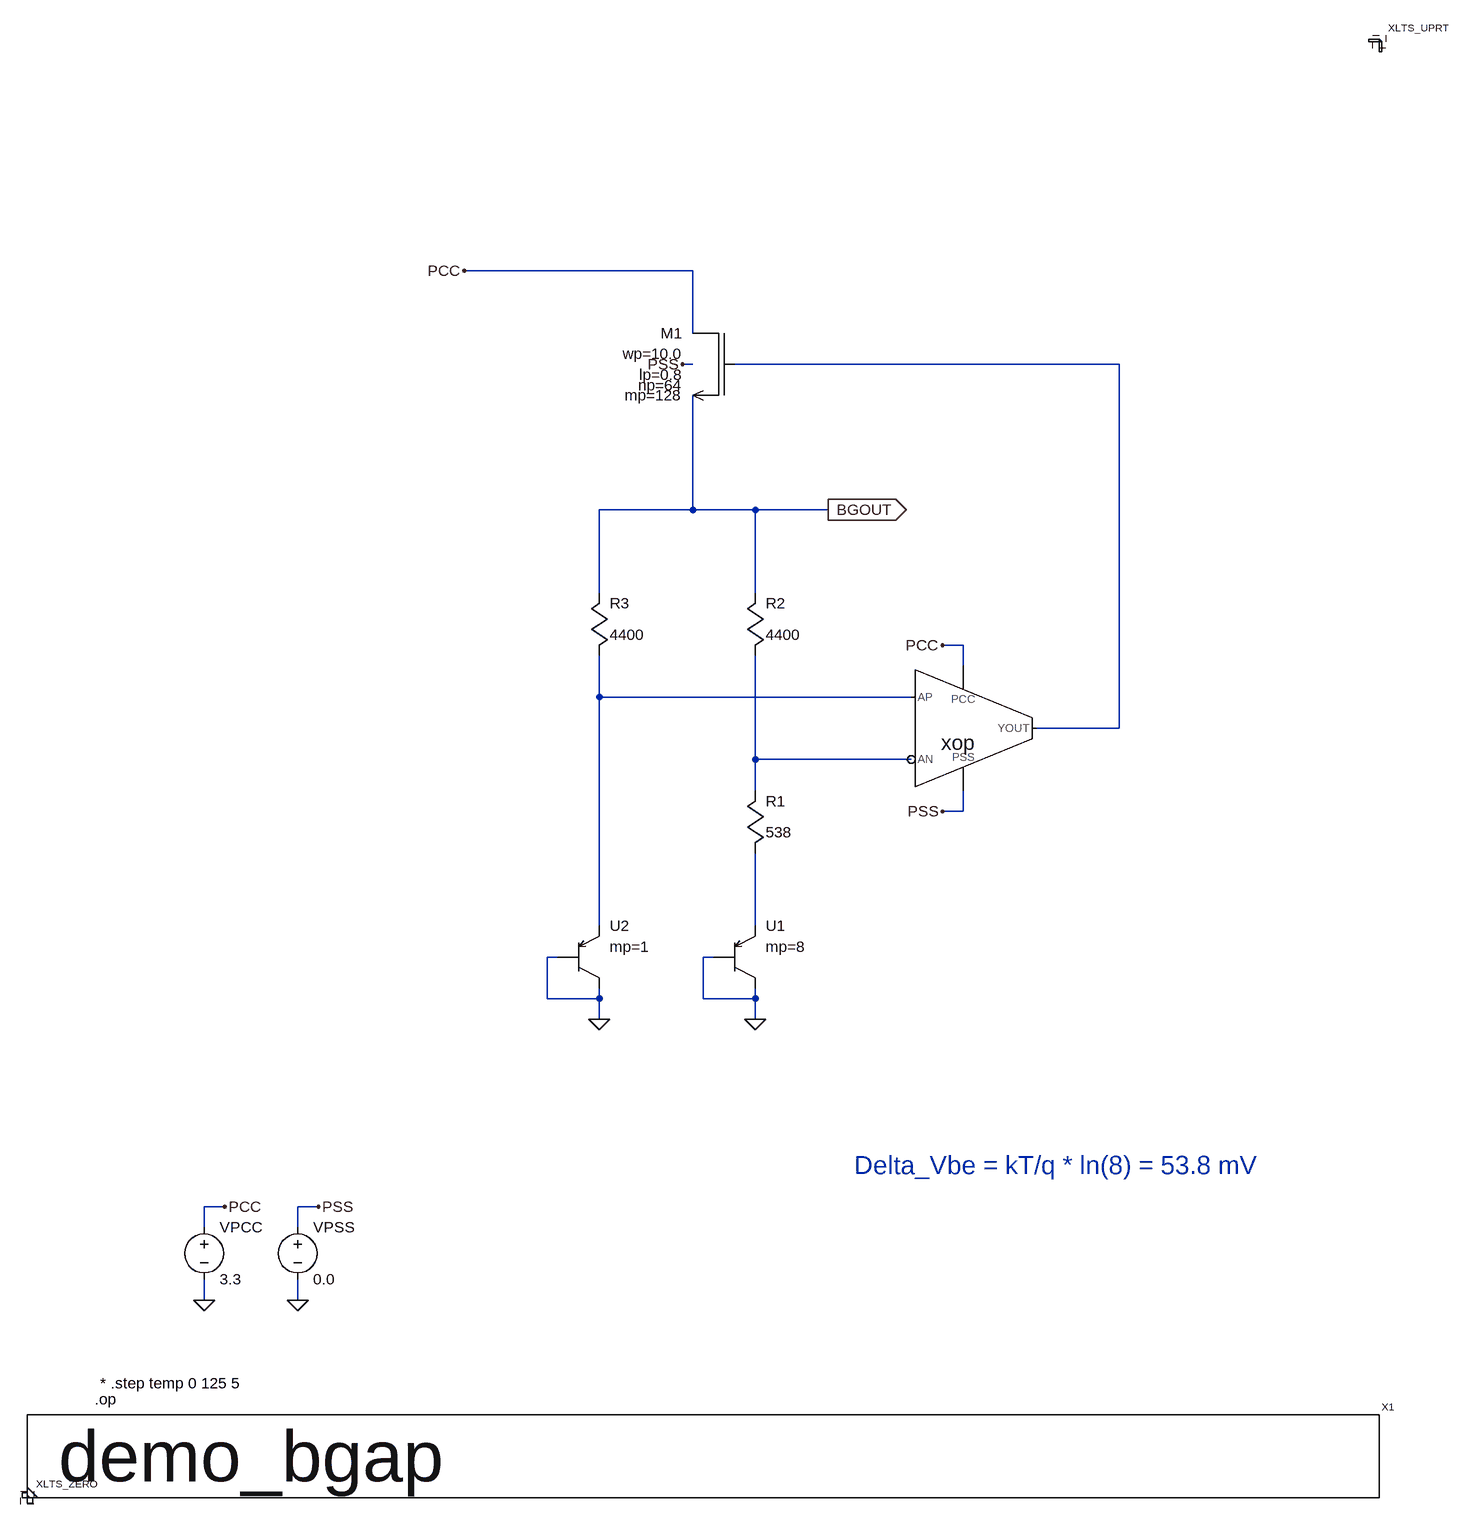
[diagram p0: schematic demo_bgap.asc]
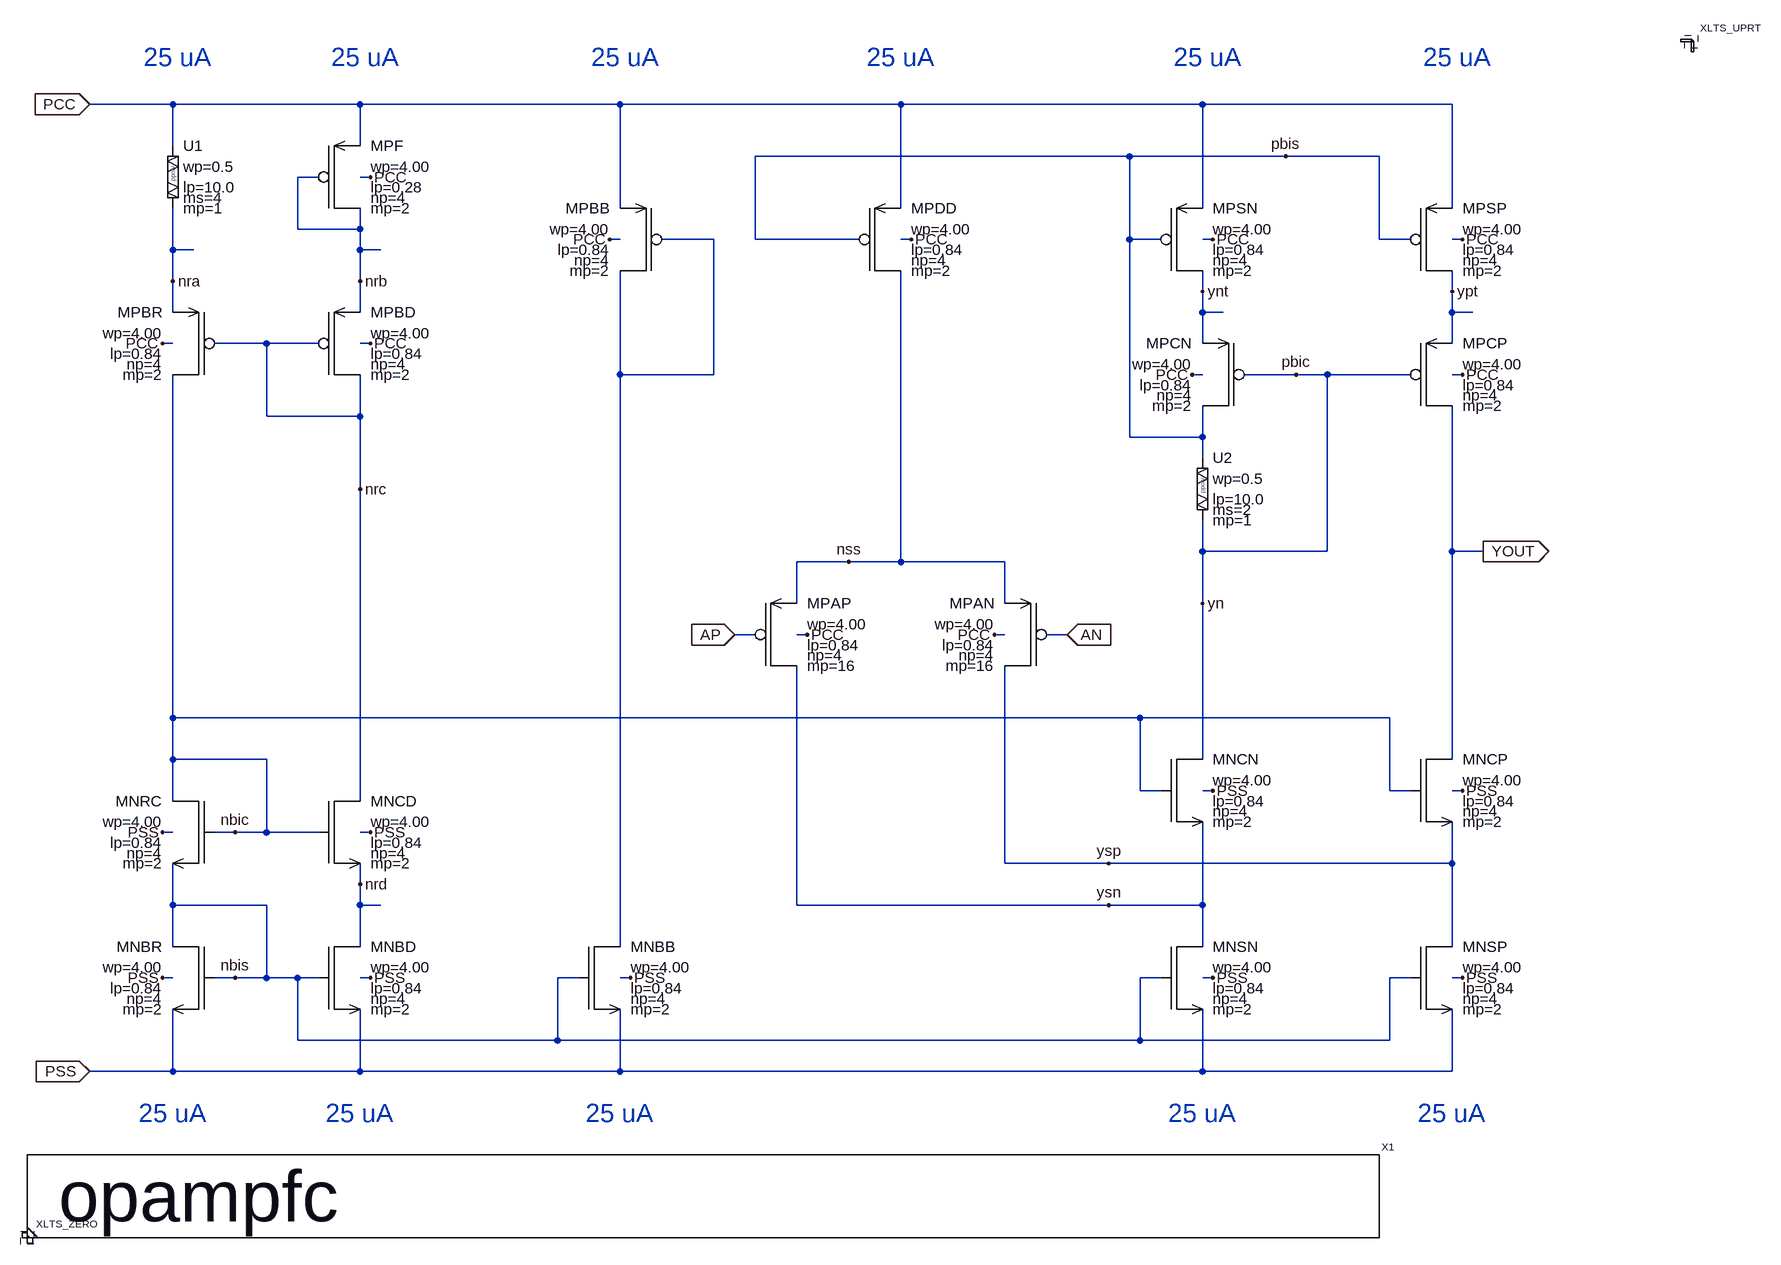
[diagram p1: sub-circuit opampfc.asc]
demo_bgap.asc, the LTspice schematic file:
Version 4.1
SHEET 1 4824 680
WIRE 1024 -1888 672 -1888
WIRE 1024 -1792 1024 -1888
WIRE 1024 -1744 1008 -1744
WIRE 1680 -1744 1088 -1744
WIRE 1024 -1520 1024 -1696
WIRE 1024 -1520 880 -1520
WIRE 1120 -1520 1024 -1520
WIRE 1232 -1520 1120 -1520
WIRE 880 -1392 880 -1520
WIRE 1120 -1392 1120 -1520
WIRE 1440 -1312 1408 -1312
WIRE 1440 -1280 1440 -1312
WIRE 880 -1232 880 -1296
WIRE 1360 -1232 880 -1232
WIRE 1680 -1184 1680 -1744
WIRE 1680 -1184 1552 -1184
WIRE 1120 -1136 1120 -1296
WIRE 1360 -1136 1120 -1136
WIRE 1120 -1088 1120 -1136
WIRE 1440 -1056 1440 -1088
WIRE 1440 -1056 1408 -1056
WIRE 880 -880 880 -1232
WIRE 1120 -880 1120 -992
WIRE 816 -832 800 -832
WIRE 1056 -832 1040 -832
WIRE 800 -768 800 -832
WIRE 880 -768 880 -784
WIRE 880 -768 800 -768
WIRE 1040 -768 1040 -832
WIRE 1120 -768 1120 -784
WIRE 1120 -768 1040 -768
WIRE 880 -736 880 -768
WIRE 1120 -736 1120 -768
WIRE 304 -448 272 -448
WIRE 448 -448 416 -448
WIRE 272 -416 272 -448
WIRE 416 -416 416 -448
WIRE 272 -304 272 -336
WIRE 416 -304 416 -336
FLAG 272 -304 0
FLAG 304 -448 PCC
FLAG 416 -304 0
FLAG 448 -448 PSS
FLAG 1120 -736 0
FLAG 880 -736 0
FLAG 1008 -1744 PSS
FLAG 1232 -1520 BGOUT
IOPIN 1232 -1520 Out
FLAG 1408 -1312 PCC
FLAG 1408 -1056 PSS
FLAG 672 -1888 PCC
DATAFLAG 784 -1888 ""
DATAFLAG 1184 -1520 ""
DATAFLAG 1264 -1232 ""
DATAFLAG 1264 -1136 ""
DATAFLAG 1600 -1184 ""
DATAFLAG 1120 -944 ""
DATAFLAG 880 -944 ""
DATAFLAG 1120 -688 "Ix(U1:e)"
DATAFLAG 880 -688 "Ix(U2:e)"
SYMBOL BD_GTitleLTS 0 0 R0
SYMATTR SpiceModel demo_bgap
SYMATTR InstName X1
SYMBOL voltage 272 -432 R0
SYMATTR InstName VPCC
SYMATTR Value 3.3
SYMBOL voltage 416 -432 R0
SYMATTR InstName VPSS
SYMATTR Value 0.0
SYMBOL opampfc 1360 -1088 R0
SYMATTR InstName xop
SYMBOL BD_ZERO 0 0 R0
SYMATTR InstName XLTS_ZERO
SYMBOL BD_UPRT 2080 -2240 R0
SYMATTR InstName XLTS_UPRT
SYMBOL gfmcu_vpnp_10x10 1056 -832 R0
SYMATTR InstName U1
SYMATTR Value mp=8
SYMBOL gfmcu_vpnp_10x10 816 -832 R0
SYMATTR InstName U2
SYMBOL gres 1120 -1088 R0
SYMATTR Value 538
SYMATTR InstName R1
SYMBOL gres 1120 -1392 R0
SYMATTR Value 4400
SYMATTR InstName R2
SYMBOL gres 880 -1392 R0
SYMATTR Value 4400
SYMATTR InstName R3
SYMBOL gfmcu_nmos3p3 1088 -1744 M0
SYMATTR Value wp=10.0
SYMATTR InstName M1
SYMATTR Value2 lp=0.8
SYMATTR SpiceLine np=64
SYMATTR SpiceLine2 mp=128
TEXT 104 -152 Left 2 !.op
TEXT 112 -176 Left 2 !* .step temp 0 125 5
TEXT 1272 -512 Left 4 ;Delta_Vbe = kT/q * ln(8) = 53.8 mV

opampfc.asc, the sub-circuit schematic file:
Version 4.1
SHEET 1 4824 680
WIRE 224 -1744 96 -1744
WIRE 512 -1744 224 -1744
WIRE 912 -1744 512 -1744
WIRE 1344 -1744 912 -1744
WIRE 1808 -1744 1344 -1744
WIRE 2192 -1744 1808 -1744
WIRE 224 -1680 224 -1744
WIRE 512 -1680 512 -1744
WIRE 1696 -1664 1120 -1664
WIRE 1936 -1664 1696 -1664
WIRE 2080 -1664 1936 -1664
WIRE 448 -1632 416 -1632
WIRE 528 -1632 512 -1632
WIRE 912 -1584 912 -1744
WIRE 1344 -1584 1344 -1744
WIRE 1808 -1584 1808 -1744
WIRE 2192 -1584 2192 -1744
WIRE 416 -1552 416 -1632
WIRE 512 -1552 512 -1584
WIRE 512 -1552 416 -1552
WIRE 912 -1536 896 -1536
WIRE 1056 -1536 976 -1536
WIRE 1120 -1536 1120 -1664
WIRE 1280 -1536 1120 -1536
WIRE 1360 -1536 1344 -1536
WIRE 1696 -1536 1696 -1664
WIRE 1744 -1536 1696 -1536
WIRE 1824 -1536 1808 -1536
WIRE 2080 -1536 2080 -1664
WIRE 2128 -1536 2080 -1536
WIRE 2208 -1536 2192 -1536
WIRE 224 -1520 224 -1584
WIRE 256 -1520 224 -1520
WIRE 512 -1520 512 -1552
WIRE 544 -1520 512 -1520
WIRE 224 -1472 224 -1520
WIRE 512 -1472 512 -1520
WIRE 1808 -1456 1808 -1488
WIRE 2192 -1456 2192 -1488
WIRE 224 -1424 224 -1472
WIRE 512 -1424 512 -1472
WIRE 1808 -1424 1808 -1456
WIRE 1840 -1424 1808 -1424
WIRE 2192 -1424 2192 -1456
WIRE 2224 -1424 2192 -1424
WIRE 224 -1376 208 -1376
WIRE 368 -1376 288 -1376
WIRE 448 -1376 368 -1376
WIRE 528 -1376 512 -1376
WIRE 1808 -1376 1808 -1424
WIRE 2192 -1376 2192 -1424
WIRE 912 -1328 912 -1488
WIRE 1056 -1328 1056 -1536
WIRE 1056 -1328 912 -1328
WIRE 1808 -1328 1792 -1328
WIRE 1952 -1328 1872 -1328
WIRE 2000 -1328 1952 -1328
WIRE 2128 -1328 2000 -1328
WIRE 2208 -1328 2192 -1328
WIRE 368 -1264 368 -1376
WIRE 512 -1264 512 -1328
WIRE 512 -1264 368 -1264
WIRE 1696 -1232 1696 -1536
WIRE 1808 -1232 1808 -1280
WIRE 1808 -1232 1696 -1232
WIRE 1808 -1200 1808 -1232
WIRE 512 -1152 512 -1264
WIRE 1808 -1056 1808 -1104
WIRE 2000 -1056 2000 -1328
WIRE 2000 -1056 1808 -1056
WIRE 2192 -1056 2192 -1280
WIRE 2240 -1056 2192 -1056
WIRE 1264 -1040 1184 -1040
WIRE 1344 -1040 1344 -1488
WIRE 1344 -1040 1264 -1040
WIRE 1504 -1040 1344 -1040
WIRE 1184 -976 1184 -1040
WIRE 1504 -976 1504 -1040
WIRE 1808 -976 1808 -1056
WIRE 1120 -928 1088 -928
WIRE 1200 -928 1184 -928
WIRE 1504 -928 1488 -928
WIRE 1600 -928 1568 -928
WIRE 224 -800 224 -1328
WIRE 1712 -800 224 -800
WIRE 2096 -800 1712 -800
WIRE 224 -736 224 -800
WIRE 368 -736 224 -736
WIRE 1808 -736 1808 -976
WIRE 2192 -736 2192 -1056
WIRE 1712 -688 1712 -800
WIRE 1744 -688 1712 -688
WIRE 1824 -688 1808 -688
WIRE 2096 -688 2096 -800
WIRE 2128 -688 2096 -688
WIRE 2208 -688 2192 -688
WIRE 224 -672 224 -736
WIRE 512 -672 512 -1152
WIRE 224 -624 208 -624
WIRE 320 -624 288 -624
WIRE 368 -624 368 -736
WIRE 368 -624 320 -624
WIRE 448 -624 368 -624
WIRE 528 -624 512 -624
WIRE 1504 -576 1504 -880
WIRE 1664 -576 1504 -576
WIRE 2192 -576 2192 -640
WIRE 2192 -576 1664 -576
WIRE 512 -544 512 -576
WIRE 224 -512 224 -576
WIRE 368 -512 224 -512
WIRE 512 -512 512 -544
WIRE 544 -512 512 -512
WIRE 1184 -512 1184 -880
WIRE 1664 -512 1184 -512
WIRE 1808 -512 1808 -640
WIRE 1808 -512 1664 -512
WIRE 224 -448 224 -512
WIRE 512 -448 512 -512
WIRE 912 -448 912 -1328
WIRE 1808 -448 1808 -512
WIRE 2192 -448 2192 -576
WIRE 224 -400 208 -400
WIRE 320 -400 288 -400
WIRE 368 -400 368 -512
WIRE 368 -400 320 -400
WIRE 416 -400 368 -400
WIRE 448 -400 416 -400
WIRE 528 -400 512 -400
WIRE 848 -400 816 -400
WIRE 928 -400 912 -400
WIRE 1744 -400 1712 -400
WIRE 1824 -400 1808 -400
WIRE 2128 -400 2096 -400
WIRE 2208 -400 2192 -400
WIRE 416 -304 416 -400
WIRE 816 -304 816 -400
WIRE 816 -304 416 -304
WIRE 1712 -304 1712 -400
WIRE 1712 -304 816 -304
WIRE 2096 -304 2096 -400
WIRE 2096 -304 1712 -304
WIRE 224 -256 224 -352
WIRE 224 -256 96 -256
WIRE 512 -256 512 -352
WIRE 512 -256 224 -256
WIRE 912 -256 912 -352
WIRE 912 -256 512 -256
WIRE 1808 -256 1808 -352
WIRE 1808 -256 912 -256
WIRE 2192 -256 2192 -352
WIRE 2192 -256 1808 -256
FLAG 528 -1376 PCC
FLAG 208 -1376 PCC
FLAG 528 -1632 PCC
FLAG 208 -400 PSS
FLAG 528 -400 PSS
FLAG 96 -256 PSS
IOPIN 96 -256 In
FLAG 96 -1744 PCC
IOPIN 96 -1744 In
FLAG 1200 -928 PCC
FLAG 1488 -928 PCC
FLAG 1824 -400 PSS
FLAG 1360 -1536 PCC
FLAG 896 -1536 PCC
FLAG 1824 -1536 PCC
FLAG 2208 -1536 PCC
FLAG 1792 -1328 PCC
FLAG 2208 -1328 PCC
FLAG 2208 -400 PSS
FLAG 1824 -688 PSS
FLAG 2208 -688 PSS
FLAG 208 -624 PSS
FLAG 528 -624 PSS
FLAG 928 -400 PSS
FLAG 1088 -928 AP
IOPIN 1088 -928 In
FLAG 1264 -1040 nss
FLAG 1936 -1664 pbis
FLAG 1952 -1328 pbic
FLAG 320 -400 nbis
FLAG 320 -624 nbic
FLAG 1808 -976 yn
FLAG 2240 -1056 YOUT
IOPIN 2240 -1056 Out
FLAG 1664 -576 ysp
FLAG 1664 -512 ysn
FLAG 1808 -1456 ynt
FLAG 2192 -1456 ypt
FLAG 224 -1472 nra
FLAG 512 -1472 nrb
FLAG 512 -1152 nrc
FLAG 512 -544 nrd
FLAG 1600 -928 AN
IOPIN 1600 -928 In
DATAFLAG 256 -1520 ""
DATAFLAG 544 -1520 ""
DATAFLAG 288 -512 ""
DATAFLAG 512 -224 "Ix(MNBD:ND)"
DATAFLAG 224 -224 "Ix(MNBR:ND)"
DATAFLAG 912 -224 "Ix(MNBB:ND)"
DATAFLAG 512 -1760 "Ix(MPBD:NS)"
DATAFLAG 224 -1760 "Ix(MPBR:NS)"
DATAFLAG 1344 -1760 "Ix(MPDD:NS)"
DATAFLAG 1808 -1760 "Ix(MPSN:NS)"
DATAFLAG 2192 -1760 "Ix(MPSP:NS)"
DATAFLAG 1808 -224 "Ix(MNSN:ND)"
DATAFLAG 2192 -224 "Ix(MNSP:ND)"
DATAFLAG 912 -1760 "Ix(MPBB:NS)"
DATAFLAG 224 -1040 ""
DATAFLAG 512 -1040 ""
DATAFLAG 544 -512 ""
DATAFLAG 912 -1040 ""
DATAFLAG 1808 -864 ""
DATAFLAG 2192 -864 ""
DATAFLAG 1840 -1424 ""
DATAFLAG 2224 -1424 ""
DATAFLAG 1440 -1664 ""
DATAFLAG 1584 -304 ""
DATAFLAG 1584 -576 ""
DATAFLAG 1584 -512 ""
SYMBOL BD_GTitleLTS 0 0 R0
SYMATTR SpiceModel opampfc
SYMATTR InstName X1
SYMBOL gfmcu_pmos3p3 448 -1376 R0
SYMATTR Value wp=4.00
SYMATTR InstName MPBD
SYMATTR Value2 lp=0.84
SYMATTR SpiceLine np=4
SYMATTR SpiceLine2 mp=2
SYMBOL gfmcu_pmos3p3 288 -1376 M0
SYMATTR Value wp=4.00
SYMATTR InstName MPBR
SYMATTR Value2 lp=0.84
SYMATTR SpiceLine np=4
SYMATTR SpiceLine2 mp=2
SYMBOL gfmcu_pmos3p3 448 -1632 R0
SYMATTR Value wp=4.00
SYMATTR InstName MPF
SYMATTR SpiceLine np=4
SYMATTR SpiceLine2 mp=2
SYMBOL gfmcu_nmos3p3 448 -400 R0
SYMATTR Value wp=4.00
SYMATTR InstName MNBD
SYMATTR Value2 lp=0.84
SYMATTR SpiceLine np=4
SYMATTR SpiceLine2 mp=2
SYMBOL gfmcu_nmos3p3 288 -400 M0
SYMATTR Value wp=4.00
SYMATTR InstName MNBR
SYMATTR Value2 lp=0.84
SYMATTR SpiceLine np=4
SYMATTR SpiceLine2 mp=2
SYMBOL gfmcu_ppolyf_u 224 -1680 R0
SYMATTR Value wp=0.5
SYMATTR InstName U1
SYMATTR Value2 lp=10.0
SYMATTR SpiceLine ms=4
SYMBOL gfmcu_pmos3p3 1120 -928 R0
SYMATTR Value wp=4.00
SYMATTR InstName MPAP
SYMATTR Value2 lp=0.84
SYMATTR SpiceLine np=4
SYMATTR SpiceLine2 mp=16
SYMBOL gfmcu_pmos3p3 1568 -928 M0
SYMATTR Value wp=4.00
SYMATTR InstName MPAN
SYMATTR Value2 lp=0.84
SYMATTR SpiceLine np=4
SYMATTR SpiceLine2 mp=16
SYMBOL gfmcu_nmos3p3 1744 -400 R0
SYMATTR Value wp=4.00
SYMATTR InstName MNSN
SYMATTR Value2 lp=0.84
SYMATTR SpiceLine np=4
SYMATTR SpiceLine2 mp=2
SYMBOL gfmcu_pmos3p3 1280 -1536 R0
SYMATTR Value wp=4.00
SYMATTR InstName MPDD
SYMATTR Value2 lp=0.84
SYMATTR SpiceLine np=4
SYMATTR SpiceLine2 mp=2
SYMBOL gfmcu_pmos3p3 976 -1536 M0
SYMATTR Value wp=4.00
SYMATTR InstName MPBB
SYMATTR Value2 lp=0.84
SYMATTR SpiceLine np=4
SYMATTR SpiceLine2 mp=2
SYMBOL gfmcu_pmos3p3 1744 -1536 R0
SYMATTR Value wp=4.00
SYMATTR InstName MPSN
SYMATTR Value2 lp=0.84
SYMATTR SpiceLine np=4
SYMATTR SpiceLine2 mp=2
SYMBOL gfmcu_pmos3p3 2128 -1536 R0
SYMATTR Value wp=4.00
SYMATTR InstName MPSP
SYMATTR Value2 lp=0.84
SYMATTR SpiceLine np=4
SYMATTR SpiceLine2 mp=2
SYMBOL gfmcu_pmos3p3 1872 -1328 M0
SYMATTR Value wp=4.00
SYMATTR InstName MPCN
SYMATTR Value2 lp=0.84
SYMATTR SpiceLine np=4
SYMATTR SpiceLine2 mp=2
SYMBOL gfmcu_pmos3p3 2128 -1328 R0
SYMATTR Value wp=4.00
SYMATTR InstName MPCP
SYMATTR Value2 lp=0.84
SYMATTR SpiceLine np=4
SYMATTR SpiceLine2 mp=2
SYMBOL gfmcu_nmos3p3 2128 -400 R0
SYMATTR Value wp=4.00
SYMATTR InstName MNSP
SYMATTR Value2 lp=0.84
SYMATTR SpiceLine np=4
SYMATTR SpiceLine2 mp=2
SYMBOL gfmcu_nmos3p3 1744 -688 R0
SYMATTR Value wp=4.00
SYMATTR InstName MNCN
SYMATTR Value2 lp=0.84
SYMATTR SpiceLine np=4
SYMATTR SpiceLine2 mp=2
SYMBOL gfmcu_nmos3p3 2128 -688 R0
SYMATTR Value wp=4.00
SYMATTR InstName MNCP
SYMATTR Value2 lp=0.84
SYMATTR SpiceLine np=4
SYMATTR SpiceLine2 mp=2
SYMBOL gfmcu_ppolyf_u 1808 -1200 R0
SYMATTR Value wp=0.5
SYMATTR InstName U2
SYMATTR Value2 lp=10.0
SYMATTR SpiceLine ms=2
SYMBOL gfmcu_nmos3p3 448 -624 R0
SYMATTR Value wp=4.00
SYMATTR InstName MNCD
SYMATTR Value2 lp=0.84
SYMATTR SpiceLine np=4
SYMATTR SpiceLine2 mp=2
SYMBOL gfmcu_nmos3p3 288 -624 M0
SYMATTR Value wp=4.00
SYMATTR InstName MNRC
SYMATTR Value2 lp=0.84
SYMATTR SpiceLine np=4
SYMATTR SpiceLine2 mp=2
SYMBOL gfmcu_nmos3p3 848 -400 R0
SYMATTR Value wp=4.00
SYMATTR InstName MNBB
SYMATTR Value2 lp=0.84
SYMATTR SpiceLine np=4
SYMATTR SpiceLine2 mp=2
TEXT 224 -192 Center 4 ;25 uA
TEXT 512 -192 Center 4 ;25 uA
TEXT 912 -192 Center 4 ;25 uA
TEXT 1808 -192 Center 4 ;25 uA
TEXT 2192 -192 Center 4 ;25 uA
TEXT 232 -1816 Center 4 ;25 uA
TEXT 520 -1816 Center 4 ;25 uA
TEXT 920 -1816 Center 4 ;25 uA
TEXT 1816 -1816 Center 4 ;25 uA
TEXT 2200 -1816 Center 4 ;25 uA
TEXT 1344 -1816 Center 4 ;25 uA
SYMBOL BD_ZERO 0 0 R0
SYMATTR InstName XLTS_ZERO
SYMBOL BD_UPRT 2560 -1840 R0
SYMATTR InstName XLTS_UPRT

The netlist it stands for:
* demo_bgap.asc
X§X1 BD_GTitleLTS
VPCC PCC 0 3.3
VPSS PSS 0 0.0
X§xop N001 N002 N003 PSS PCC opampfc
X§XLTS_ZERO BD_ZERO
X§XLTS_UPRT BD_UPRT
X§U1 0 0 N004 gfmcu_vpnp_10x10 mp=8  ; pins c b e
X§U2 0 0 N002 gfmcu_vpnp_10x10 mp=1  ; pins c b e
R1 N003 N004 538
R2 BGOUT N003 4400
R3 BGOUT N002 4400
X§M1 PCC N001 BGOUT PSS gfmcu_nmos3p3 wp=10.0 lp=0.8 np=64 mp=128  ; pins ND NG NS NB

* block symbol definitions
.subckt opampfc YOUT AP AN PSS PCC
X§X1 BD_GTitleLTS
X§MPBD nrc nrc nrb PCC gfmcu_pmos3p3 wp=4.00 lp=0.84 np=4 mp=2  ; pins ND NG NS NB
X§MPBR nbic nrc nra PCC gfmcu_pmos3p3 wp=4.00 lp=0.84 np=4 mp=2  ; pins ND NG NS NB
X§MPF nrb nrb PCC PCC gfmcu_pmos3p3 wp=4.00 lp=0.28 np=4 mp=2  ; pins ND NG NS NB
X§MNBD nrd nbis PSS PSS gfmcu_nmos3p3 wp=4.00 lp=0.84 np=4 mp=2  ; pins ND NG NS NB
X§MNBR nbis nbis PSS PSS gfmcu_nmos3p3 wp=4.00 lp=0.84 np=4 mp=2  ; pins ND NG NS NB
X§U1 PCC nra gfmcu_ppolyf_u wp=0.5 lp=10.0 ms=4 mp=1  ; pins ND NS
X§MPAP ysn AP nss PCC gfmcu_pmos3p3 wp=4.00 lp=0.84 np=4 mp=16  ; pins ND NG NS NB
X§MPAN ysp AN nss PCC gfmcu_pmos3p3 wp=4.00 lp=0.84 np=4 mp=16  ; pins ND NG NS NB
X§MNSN ysn nbis PSS PSS gfmcu_nmos3p3 wp=4.00 lp=0.84 np=4 mp=2  ; pins ND NG NS NB
X§MPDD nss pbis PCC PCC gfmcu_pmos3p3 wp=4.00 lp=0.84 np=4 mp=2  ; pins ND NG NS NB
X§MPBB N001 N001 PCC PCC gfmcu_pmos3p3 wp=4.00 lp=0.84 np=4 mp=2  ; pins ND NG NS NB
X§MPSN ynt pbis PCC PCC gfmcu_pmos3p3 wp=4.00 lp=0.84 np=4 mp=2  ; pins ND NG NS NB
X§MPSP ypt pbis PCC PCC gfmcu_pmos3p3 wp=4.00 lp=0.84 np=4 mp=2  ; pins ND NG NS NB
X§MPCN pbis yn ynt PCC gfmcu_pmos3p3 wp=4.00 lp=0.84 np=4 mp=2  ; pins ND NG NS NB
X§MPCP YOUT yn ypt PCC gfmcu_pmos3p3 wp=4.00 lp=0.84 np=4 mp=2  ; pins ND NG NS NB
X§MNSP ysp nbis PSS PSS gfmcu_nmos3p3 wp=4.00 lp=0.84 np=4 mp=2  ; pins ND NG NS NB
X§MNCN yn nbic ysn PSS gfmcu_nmos3p3 wp=4.00 lp=0.84 np=4 mp=2  ; pins ND NG NS NB
X§MNCP YOUT nbic ysp PSS gfmcu_nmos3p3 wp=4.00 lp=0.84 np=4 mp=2  ; pins ND NG NS NB
X§U2 pbis yn gfmcu_ppolyf_u wp=0.5 lp=10.0 ms=2 mp=1  ; pins ND NS
X§MNCD nrc nbic nrd PSS gfmcu_nmos3p3 wp=4.00 lp=0.84 np=4 mp=2  ; pins ND NG NS NB
X§MNRC nbic nbic nbis PSS gfmcu_nmos3p3 wp=4.00 lp=0.84 np=4 mp=2  ; pins ND NG NS NB
X§MNBB N001 nbis PSS PSS gfmcu_nmos3p3 wp=4.00 lp=0.84 np=4 mp=2  ; pins ND NG NS NB
X§XLTS_ZERO BD_ZERO
X§XLTS_UPRT BD_UPRT
* 25 uA
* 25 uA
* 25 uA
* 25 uA
* 25 uA
* 25 uA
* 25 uA
* 25 uA
* 25 uA
* 25 uA
* 25 uA
.ends opampfc

.op
* .step temp 0 125 5
* Delta_Vbe = kT/q * ln(8) = 53.8 mV
.lib models_gfmcu.lib
.lib dmodels_analog.lib
.backanno
.end